# Altium schematic sheet Input_Stage.SchDoc
size 254 x 177 mm; SheetNumber: 1; SheetTotal: 3
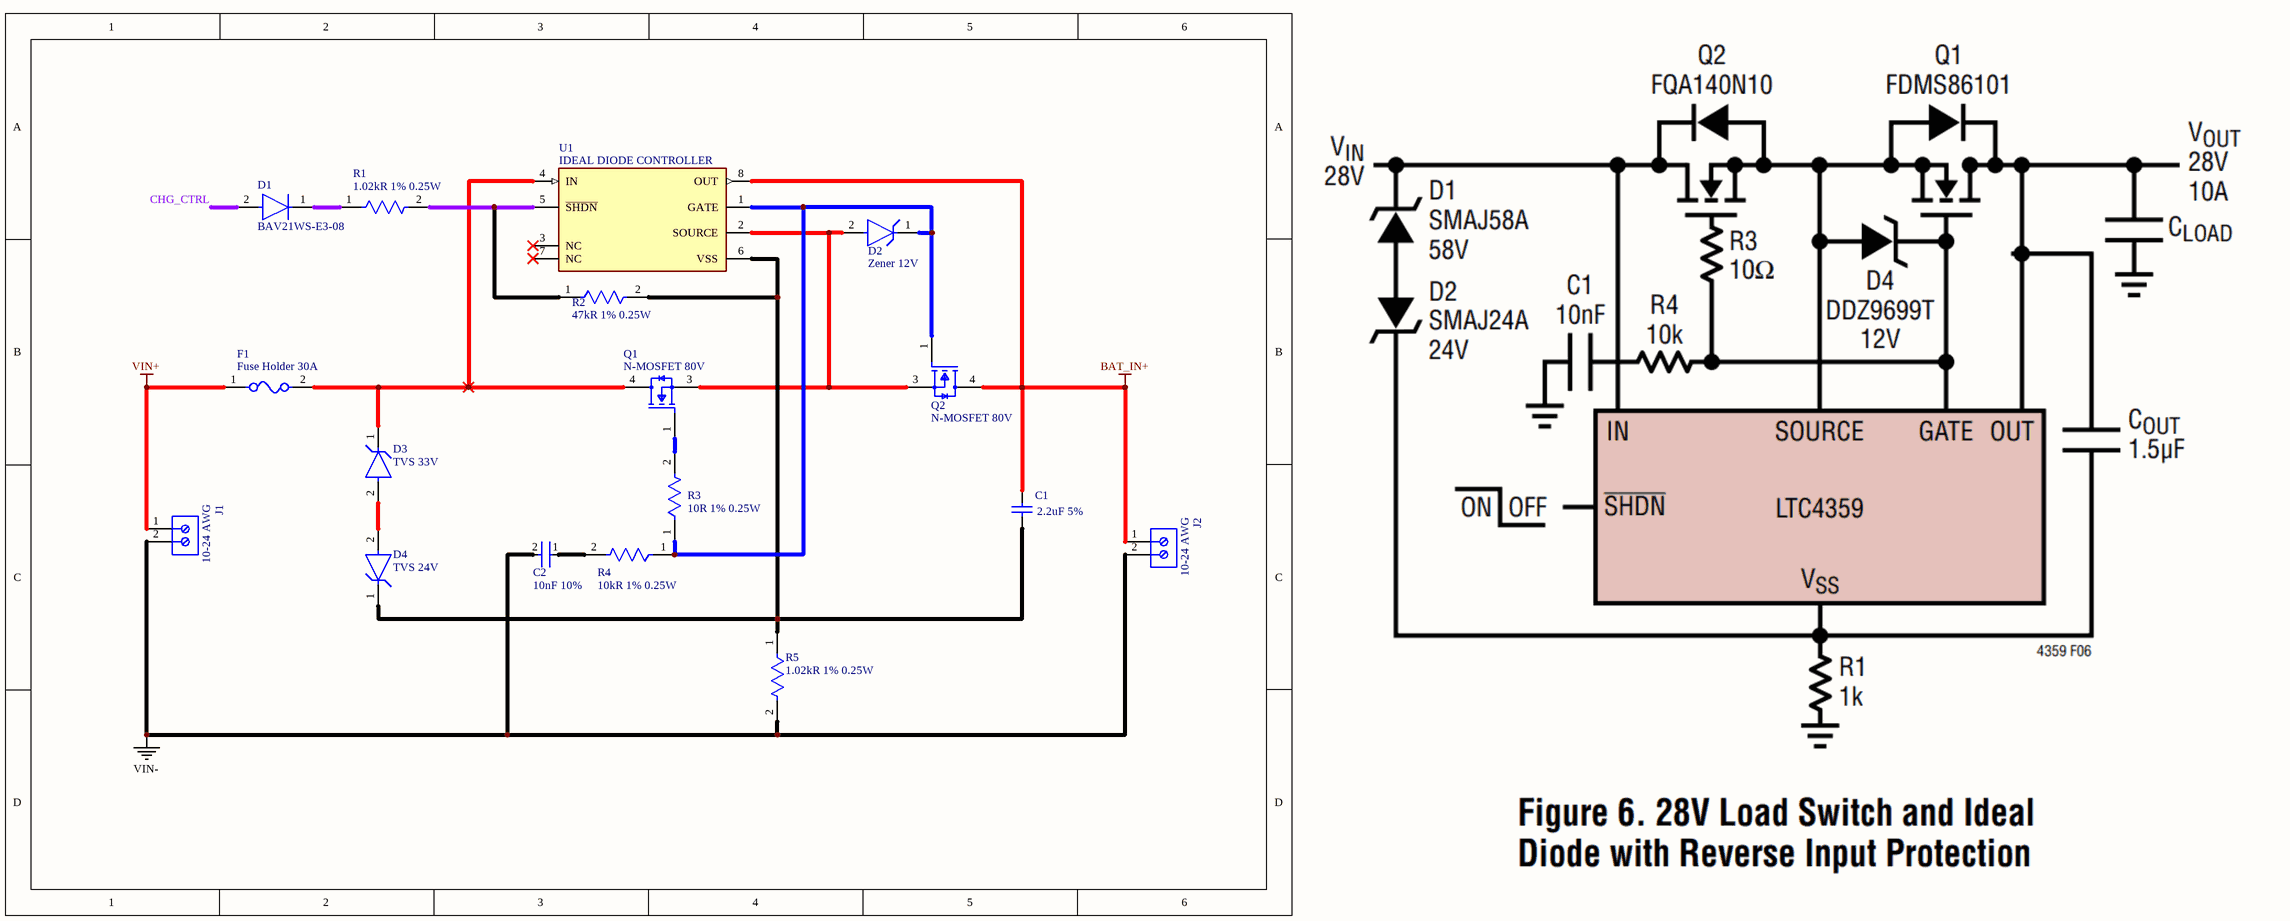
[diagram p0: Input_Stage.SchDoc]

## Parts
C1  2.2uF 5%  [WCAP-FTBP_L18W10H16.5]
C2  10nF 10%  [FP-C1608-080-0_1-MFG]
D1  BAV21WS-E3-08  [FP-S8-V-3910_02-001-MFG]
D2  Zener 12V  [FP-017AH-MFG]
D3  TVS 33V  [FP-SMCJ-MFG]
D4  TVS 24V  [FP-SMAJ-MFG]
F1  Fuse Holder 30A  [FP-3568-MFG]
J1  10-24 AWG  [PHOE-1714955_V]
J2  10-24 AWG  [PHOE-1714955_V]
Q1  N-MOSFET 80V  [FP-PG-TO263-3-MFG]
Q2  N-MOSFET 80V  [FP-PG-TO263-3-MFG]
R1  1.02kR 1% 0.25W  [FP-RT1206-MFG]
R2  47kR 1% 0.25W  [FP-RT1206-MFG]
R3  10R 1% 0.25W  [FP-RT1206-MFG]
R4  10kR 1% 0.25W  [FP-RT1206-MFG]
R5  1.02kR 1% 0.25W  [FP-RT1206-MFG]
U1  IDEAL DIODE CONTROLLER  [FP-S8-8-05-08-1610-IPC_C]

## Nets
BAT_IN+: C1.1 J2.1 Q2.4(D) U1.8(OUT)
VIN+: F1.1 J1.1
VIN-: C2.2 J1.2 J2.2 R5.2
CHG_CTRL: D1.2(A)
NetC1_2: C1.2 D4.1(C) R2.2 R5.1 U1.6(VSS)
NetC2_1: C2.1 R4.2
NetD1_1: D1.1(C) R1.1
NetD2_1: D2.1(C) Q2.1(G) R3.1 R4.1 U1.1(GATE)
NetD2_2: D2.2(A) Q1.3(S) Q2.3(S) U1.2(SOURCE)
NetD3_1: D3.1(C) F1.2 Q1.4(D) U1.4(IN)
NetD3_2: D3.2(A) D4.2(A)
NetQ1_1: Q1.1(G) R3.2
NetR1_2: R1.2 R2.1 U1.5(~{SHDN})

Not connected (* = marked no-connect by the designer): U1 3(NC)* 7(NC)*

## Library data of the parts
C1 = CMP-03913-89437347-3: 890443325010CS / Cap, 2.2Uf, 160V, Film, Radial Rohs Compliant: Yes; Insulation Resistance: 4.55GΩ; Pin Length: 4mm; Pitch: 15mm; ESR (Equivalent Series Resistance): 10.5mΩ; Capacitance: 2.2µF; Min Operating Temperature: -40°C; Width: 10mm; Packaging: Carton; RoHS: Compliant; Length: 18mm; Max Operating Temperature: 105°C; Voltage Rating: 160V; Height: 16.5mm
C2 = CMP-08246-003501-1: C1608X7R2A103K080AA / Multilayer Ceramic Capacitors 10nF ±10% 100V X7R SMD 0603; Voltage: 100V; Dielectric: X7R; Mount: Surface Mount; Packaging: Tape and Reel; Case/Package: 0603; Tolerance: 10%; Resistor Type: Ceramic; Case Code (Metric): 1608; Lead Free: Lead Free; RoHS Compliant: Yes; Radiation Hardening: No; Depth: 0.8mm; Thickness: 0.037inch; Length: 1.6mm; Case Code (Imperial): 0603; REACH SVHC: No SVHC; Min Operating Temperature: -55°C; Voltage Rating (DC): 100V; Series: C; Max Operating Temperature: 125°C; Construction: Flat; Number of Pins: 2; Package Quantity: 1; Termination: SMD/SMT; Voltage Rating: 100V; Capacitance: 10nF; Height: 0.8mm; Width: 0.8mm; Weight: 7.1E-05oz
D1 = CMP-02540-000084-1: DIODE GEN PURP 200V 250MA SOD323; Max Forward Surge Current (Ifsm): 1A; Max Surge Current: 625mA; Max Repetitive Reverse Voltage (Vrrm): 250V; Forward Voltage: 1.25V; Power Dissipation: 200mW; Reverse Recovery Time: 50ns; Element Configuration: Single; Max Reverse Current: 15uA; Forward Current: 200mA; Diode Capacitance-Max: 1.5pF; Max Reverse Leakage Current: 100nA; Contact Plating: Tin; Min Operating Temperature: -55°C; Package Quantity: 15000; Packaging: Tape and Reel; Lead Free: Lead Free; Case/Package: SOD-323-2; Series: Automotive, AEC-Q101; Number of Pins: 2; RoHS Compliant: Yes; Weight: 0.000152oz; Reverse Recovery Time-Max: 50ns; Mount: Surface Mount; Peak Non-Repetitive Surge Current: 1A; Max Reverse Voltage (DC): 200V; Max Power Dissipation: 200mW; Max Operating Temperature: 150°C; Average Rectified Current: 250mA
D2 = CMP-07164-000008-1: BZX85C12 / DIODE ZENER 12V 1W DO41; Manufacturer: ON Semiconductor; Max Zener Voltage: 12.7V; Zener Impedance: 9Ω; Reverse Voltage: 8.4V; Forward Current: 200mA; Max Reverse Leakage Current: 0.5uA; Max Junction Temp: +200°C; Device Class L3: Zener Diodes; Device Class L2: Diodes; ComponentLink2URL: https://www.onsemi.com/pub/Collateral/BZX85C3V3-D.PDF; Mouser Description: Zener Diodes 12V 1W Zener; Automotive: No; Ipc Land Pattern Name: DIOPA1088W105L520D272; Digikey Description: DIODE ZENER 12V 1W DO41; Power Dissipation: 1W; Temperature Range High: +200°C; Height: 2.72mm; Package: 017AH; RoHS: TRUE; Category: Diode; Lead Free: Yes; Octopart: https://octopart.com/bzx85c12-on+semiconductor-84409056; Device Class L1: Discrete Semiconductors; Nom Zener Voltage: 12V; Manufacturer Part Number: BZX85C12; Temperature Range Low: -65°C; Footprint Url: https://www.onsemi.com/pub/Collateral/017AH.PDF; Temperature: -65°C to +200°C; ComponentLink2Description: Datasheet
D3 = CMP-2000-07107-2: SMCJ33A / TVS DIODE 33V 53.3V DO214AB; Manufacturer: Littelfuse Inc; Breakdown Voltage: 36.7V; Number Of Channels: 1; Direction: Unidirectional; Peak Pulse Power: 1500W; Peak Pulse Current: 28.2A; Max Junction Temp: +150°C; Lead Free: Yes; Temperature Range High: +150°C; Device Class L1: Circuit Protection; Category: Diode; Package: SMCJ; Device Class L2: TVS Diodes; Manufacturer Part Number: SMCJ33A; Temperature Range Low: -65°C; Automotive: No; Reverse Standoff Voltage: 33V; Device Class L3: unset; Height: 2.62mm; RoHS: TRUE; Digikey Description: TVS DIODE 33V 53.3V DO214AB; Temperature: -65°C to +150°C; Mouser Description: Diode Transient Voltage Suppressor (TVS) Single Uni Directional 33V 1.5KW 2-Pin SMC T/R; Clamping Voltage: 53.3V; ComponentLink2URL: https://upverter.com/datasheet/776ad76c8c447792c68262141a14e01aaf7c6fbe.pdf; ComponentLink2Description: Datasheet; Octopart: https://octopart.com/smcj33a-littelfuse-351660
D4 = CMP-08607-000085-1: SMAJ24A / TVS DIODE 24V 38.9V DO214AC; Manufacturer: Littelfuse Inc; Direction: Unidirectional; Peak Pulse Power: 400W; Peak Pulse Current: 10.3A; Max Junction Temp: +150°C; Breakdown Voltage: 26.7V; Number Of Channels: 1; ComponentLink2Description: Datasheet; Device Class L3: unset; Height: 2.29mm; ComponentLink2URL: https://www.littelfuse.com/~/media/electronics/datasheets/tvs_diodes/littelfuse_tvs_diode_smaj_datasheet.pdf.pdf; Device Class L1: Circuit Protection; Package: SMAJ; Temperature Range High: +150°C; Device Class L2: TVS Diodes; Clamping Voltage: 38.9V; Reverse Standoff Voltage: 24V; Manufacturer Part Number: SMAJ24A; Mouser Description: In a Pack of 25, Littelfuse SMAJ24A, Uni-Directional TVS Diode, 400W, 2-Pin DO-214AC; Digikey Description: TVS DIODE 24V 38.9V DO214AC; Lead Free: Yes; Octopart: https://octopart.com/smaj24a-littelfuse-350003; Automotive: No; Temperature Range Low: -65°C; Category: Diode; RoHS: TRUE; Temperature: -65°C to +150°C
F1 = CMP-2000-05464-2: 3568; NexarPartId: 8116161; Approvals: UL; Body Material: Nylon; Illumination Type: Illuminated; Voltage Rating (AC): 500V; Current Rating: 20A; Number of Poles: 1; Color: Black; Material: Brass, Nylon, Tin; Depth: 6.73mm; Max Operating Temperature: 145°C; Length: 16mm; Mount: PCB, Vertical; REACH SVHC: No SVHC; Lead Free: Lead Free; Min Operating Temperature: -50°C; Flammability Rating: UL94 V-0; RoHS: Compliant; Orientation: Vertical; Fuse Current: 20A; Termination: PC Pin; Number of Circuits: 1; Contact Plating: Tin; Voltage: 500V; Contact Material: Brass
J1 J2 = CMP-2000-05797-1: 1714955 / PC Terminal Block, Pitch 6.35 mm, 1 x 2 Position, Height 21.5 mm, Tail Lenght 5.1 mm, RoHS, Bulk; Manufacturer: Phoenix Contact; Package Description: PC Terminal Block, Pitch 6.35 mm, 1 x 2 Position, Height 21.5 mm, Tail Lenght 5.1 mm; Datasheet URL: http://media.digikey.com/pdf/Data%20Sheets/Phoenix%20Contact%20PDFs/1714955.pdf; Package Reference: 1714955; Manufacturer URL: http://www.phoenixcontact.com/; Datasheet Version: 02/2010; Mounting Technology: ThroughHole
Q1 Q2 = CMP-32901-001127-1: IPB031N08N5ATMA1 / MOSFET N-CH 80V 120A D2PAK; Element Configuration: Single; Gate to Source Voltage (Vgs): 20V; Rise Time: 18ns; Rds On Max: 3.1mR; Drain to Source Resistance: 4.1mR; Number of Channels: 1; Fall Time: 12ns; Max Power Dissipation: 167W; Turn-Off Delay Time: 37ns; Polarity: N-CHANNEL; Input Capacitance: 6.24nF; Max Operating Temperature: 175°C; Packaging: Tape and Reel; Package Quantity: 1000; Lead Free: Contains Lead; Min Operating Temperature: -55°C; Drain to Source Voltage (Vdss): 80V; Mount: Surface Mount; Max Dual Supply Voltage: 80V; RoHS Compliant: Yes; Weight: 0.139332oz; Turn-On Delay Time: 18ns; Halogen Free: Halogen Free; Drain to Source Breakdown Voltage: 80V; Series: OptiMOS™; Case/Package: TO-263-3; Continuous Drain Current (ID): 120A; Number of Pins: 3
R1 R5 = CMP-03412-017249-1: RT1206FRE071K02L / RES SMD 1.02K OHM 1% 1/4W 1206; Manufacturer: Yageo; Resistance: 1.02KΩ; Voltage Rating: 200V; Value: 1.02KΩ; Temperature Coefficient: 50 ppm/°C; Tolerance: 0.0002; Automotive: No; Height: 0.65mm; Digikey Description: RES SMD 1.02K OHM 1% 1/4W 1206; Category: Res; ComponentLink2Description: Datasheet; ComponentLink2URL: http://www.yageo.com/documents/recent/PYu-RT_1-to-0.01_RoHS_L_9.pdf; Series: RT; Temperature Range High: +155°C; Device Class L2: Resistors; Octopart: https://octopart.com/rt1206fre071k02l-yageo-1242575; Temperature: -55°C to +155°C; Lead Free: Yes; Package: RT1206; Composition: Thin Film; Device Class L3: Chip SMD Resistors; RoHS: TRUE; Temperature Range Low: -55°C; Manufacturer Part Number: RT1206FRE071K02L; Power Rating: 0.25W; Ipc Land Pattern Name: RESC310160X55; Mouser Description: Thin Film Resistors - SMD 1/4W 1.02K ohm 1% 50ppm; Footprint Url: http://www.yageo.com/exep/pages/download/literatures/PYu-R_Mount_10.pdf; Device Class L1: Passive Components
R2 = CMP-2003-04092-2: RT1206FRE0747KL / RES SMD 47K OHM 1% 1/4W 1206; Manufacturer: Yageo; Voltage Rating: 200V; Value: 47KΩ; Tolerance: 0.0002; Temperature Coefficient: 50 ppm/°C; Category: Res; Digikey Description: RES SMD 47K OHM 1% 1/4W 1206; Device Class L3: Chip SMD Resistors; Lead Free: Yes; Octopart: https://octopart.com/rt1206fre0747kl-yageo-1208366; RoHS: TRUE; Ipc Land Pattern Name: RESC310160X55; Automotive: No; Series: RT; Power Rating: 0.25W; ComponentLink2Description: Datasheet; Mouser Description: Thin Film Resistors - SMD 1/4W 47K ohm 1% 50ppm; Composition: Thin Film; Temperature: -55°C to +155°C; Package: RT1206; Device Class L1: Passive Components; Resistance: 47KΩ; Device Class L2: Resistors; Manufacturer Part Number: RT1206FRE0747KL; Temperature Range Low: -55°C; Height: 0.65mm; ComponentLink2URL: http://www.yageo.com/documents/recent/PYu-RT_1-to-0.01_RoHS_L_9.pdf; Temperature Range High: +155°C; Footprint Url: http://www.yageo.com/exep/pages/download/literatures/PYu-R_Mount_10.pdf
R3 = CMP-2003-04091-2: RT1206FRE0710RL / RES SMD 10 OHM 1% 1/4W 1206; Manufacturer: Yageo; Temperature Coefficient: 50 ppm/°C; Value: 10Ω; Voltage Rating: 200V; Tolerance: 0.0002; Temperature Range Low: -55°C; Digikey Description: RES SMD 10 OHM 1% 1/4W 1206; Power Rating: 0.25W; Footprint Url: http://www.yageo.com/exep/pages/download/literatures/PYu-R_Mount_10.pdf; Octopart: https://octopart.com/rt1206fre0710rl-yageo-1385105; Lead Free: Yes; Temperature: -55°C to +155°C; Package: RT1206; Ipc Land Pattern Name: RESC310160X55; Device Class L2: Resistors; Composition: Thin Film; Category: Res; Series: RT; Automotive: No; RoHS: TRUE; Temperature Range High: +155°C; Manufacturer Part Number: RT1206FRE0710RL; Device Class L1: Passive Components; Height: 0.65mm; Device Class L3: Chip SMD Resistors; ComponentLink2Description: Datasheet; Mouser Description: High Precision-High Stability Chip Resistor Thin Film 1206 10Ohm 1% Paper T/R; ComponentLink2URL: http://www.yageo.com/documents/recent/PYu-RT_1-to-0.01_RoHS_L_9.pdf; Resistance: 10Ω
R4 = CMP-2003-04299-2: RT1206FRE0710KL / RES 10.0K OHM 1/4W 1% SMD 1206; Manufacturer: Yageo; Voltage Rating: 200V; Temperature Coefficient: 50 ppm/°C; Tolerance: 0.0002; Value: 10KΩ; Height: 0.65mm; Composition: Thin Film; Temperature Range Low: -55°C; Temperature Range High: +155°C; Device Class L2: Resistors; Power Rating: 0.25W; RoHS: TRUE; Digikey Description: RES 10.0K OHM 1/4W 1% SMD 1206; Manufacturer Part Number: RT1206FRE0710KL; Device Class L1: Passive Components; ComponentLink2URL: http://www.yageo.com/documents/recent/PYu-RT_1-to-0.01_RoHS_L_9.pdf; Category: Res; Lead Free: Yes; Mouser Description: Thin Film Resistors 1/4W 10K ohm 1% 50ppm; Octopart: https://octopart.com/rt1206fre0710kl-yageo-1169575; ComponentLink2Description: Datasheet; Footprint Url: http://www.yageo.com/exep/pages/download/literatures/PYu-R_Mount_10.pdf; Ipc Land Pattern Name: RESC310160X55; Package: RT1206; Automotive: No; Device Class L3: Chip SMD Resistors; Temperature: -55°C to +155°C; Series: RT; Resistance: 10KΩ
U1 = CMP-09131-000172-1: LTC4359IS8#PBF / IDEAL DIODE CONTROLLER WITH REVE; RoHS Compliant: Yes